# Altium schematic sheet Controller_Section.SchDoc
size A4; DocumentNumber: 7; SheetNumber: 7; SheetTotal: 17
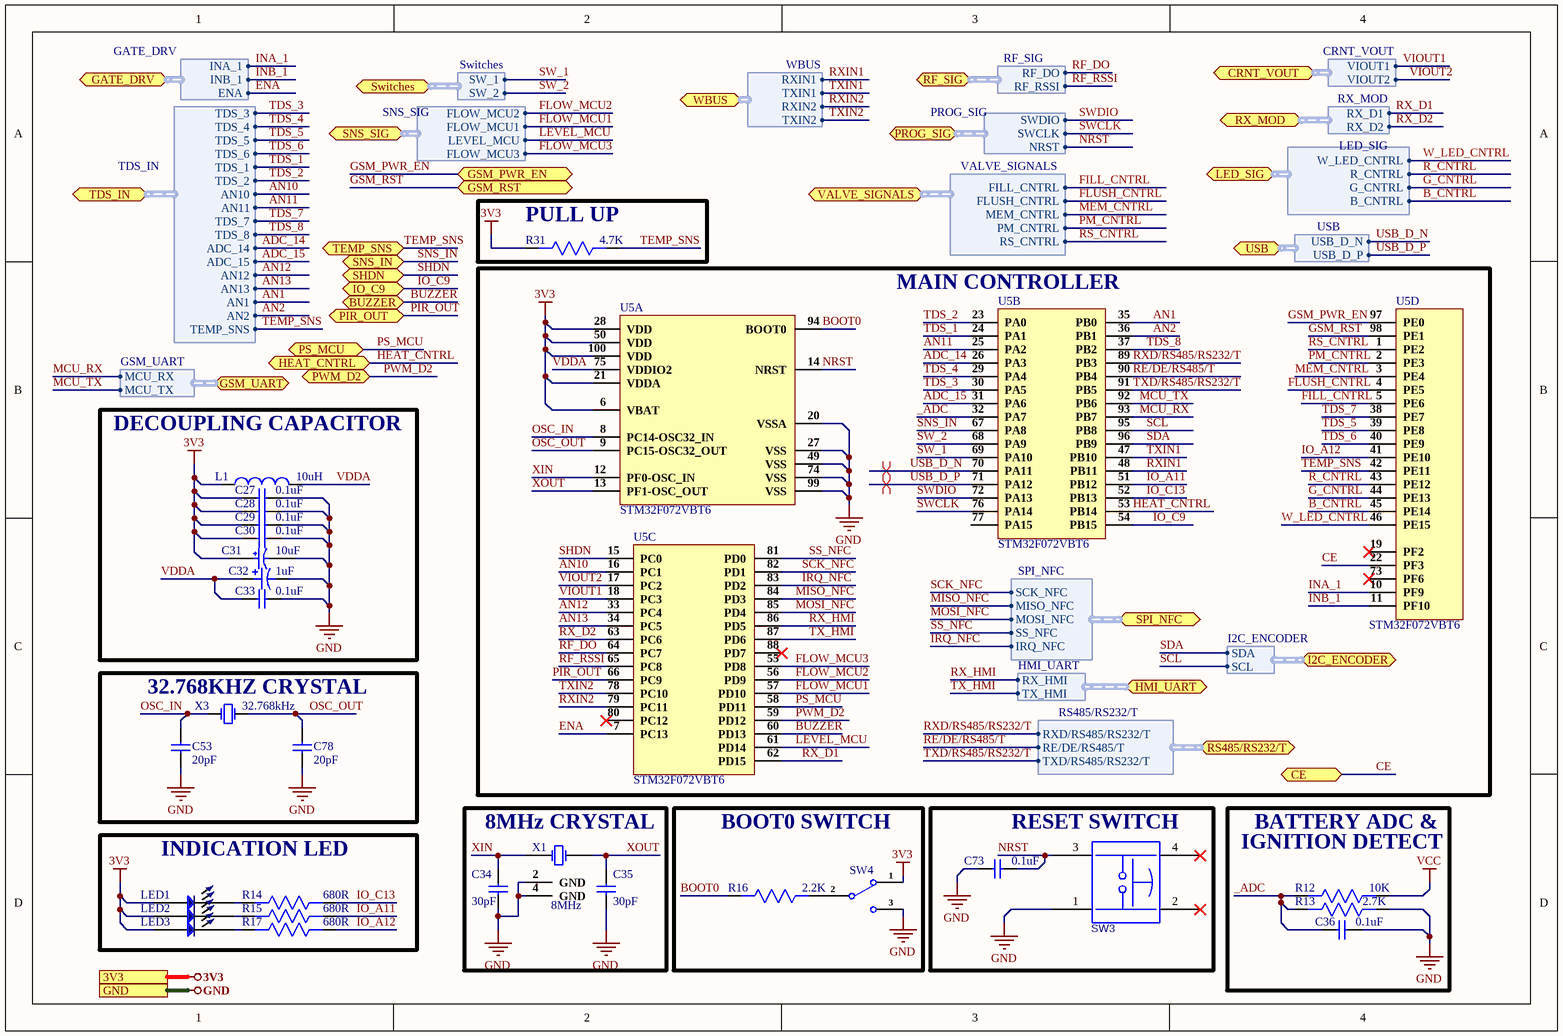
[diagram p0: Controller_Section.SchDoc]

## Parts
C27  0.1uF  [Cap0603]
C28  0.1uF  [Cap0603]
C29  0.1uF  [Cap0603]
C30  0.1uF  [Cap0603]
C31  10uF  [RVT1E100M0405.]
C32  1uF  [CAP-CASE A]
C33  0.1uF  [Cap0603]
C34  30pF  [Cap0603]
C35  30pF  [Cap0603]
C36  0.1uF  [Cap0603]
C53  20pF  [Cap0603]
C73  0.1uF  [Cap0603]
C78  20pF  [Cap0603]
L1  10uH  [Ind0805]
LED1  XZMDK68W-2  [LED 0402]  (value not drawn)
LED2  XZMDK68W-2  [LED 0402]  (value not drawn)
LED3  XZMDK68W-2  [LED 0402]  (value not drawn)
R12  10K  [Res-0603]
R13  2.7K  [Res-0603]
R14  680R  [RES-0603]
R15  680R  [RES-0603]
R16  2.2K  [RES-0603]
R17  680R  [RES-0603]
R31  4.7K  [RES-0603]
SW3  Tactile Switch  [TL3300CF160Q]  (value not drawn)
SW4  SS-12D02-G040  [SS-12D02-G040]  (value not drawn)
U5  STM32F072VBT6  [LQFP-100]  (parts A,B,C,D of 4)
X1  8MHz  [XC32M4-8.000-F18LJDT]
X3  32.768kHz  [X321532768KGD2SI]

## Blocks framed on the sheet
PULL UP: R31
MAIN CONTROLLER: U5
DECOUPLING CAPACITOR: C27-C33 L1
32.768KHZ CRYSTAL: C53 C78 X3
INDICATION LED: LED1-LED3 R14 R15 R17
8MHz CRYSTAL: C34 C35 X1
BOOT0 SWITCH: R16 SW4
RESET SWITCH: C73 SW3

## Ports
3V3, BUZZER (bidir), CE (bidir), CRNT_VOUT (bidir, harness CRNT_VOUT), GATE_DRV (bidir, harness GATE_DRV), GND, GSM_PWR_EN (bidir), GSM_RST (bidir), GSM_UART (bidir, harness GSM_UART), HEAT_CNTRL (bidir), HMI_UART (bidir, harness HMI_UART), I2C_ENCODER (bidir, harness I2C_ENCODER), IO_C9 (bidir), LED_SIG (bidir, harness LED_SIG), PIR_OUT (bidir), PROG_SIG (bidir, harness PROG_SIG), PS_MCU (bidir), PWM_D2 (bidir), RF_SIG (bidir, harness RF_SIG), RS485/RS232/T (bidir, harness RS485/RS232/T), RX_MOD (bidir, harness RX_MOD), SHDN (bidir), SNS_IN (bidir), SNS_SIG (bidir, harness SNS_SIG), SPI_NFC (bidir, harness SPI_NFC), Switches (bidir, harness Switches), TDS_IN (bidir, harness TDS_IN), TEMP_SNS (bidir), USB (bidir, harness USB), VALVE_SIGNALS (bidir, harness VALVE_SIGNALS), WBUS (bidir, harness WBUS)

## Harnesses
PROG_SIG: SWDIO, SWCLK, NRST
GATE_DRV: INA_1, INB_1, ENA
LED_SIG: R_CNTRL, G_CNTRL, B_CNTRL, W_LED_CNTRL
VALVE_SIGNALS: FILL_CNTRL, FLUSH_CNTRL, MEM_CNTRL, PM_CNTRL, RS_CNTRL
SNS_SIG: FLOW_MCU1, LEVEL_MCU, FLOW_MCU2, FLOW_MCU3
WBUS: RXIN1, TXIN1, RXIN2, TXIN2
RF_SIG: RF_DO, RF_RSSI
RX_MOD: RX_D1, RX_D2
CRNT_VOUT: VIOUT1, VIOUT2
TDS_IN: TDS_1, TDS_2, AN10, AN11, TDS_3, TDS_4, TDS_5, TDS_6, TDS_7, TDS_8, ADC_14, ADC_15, AN12, AN13, AN1, AN2, TEMP_SNS
USB: USB_D_N, USB_D_P
Switches: SW_1, SW_2
HMI_UART: RX_HMI, TX_HMI
GSM_UART: MCU_RX, MCU_TX
I2C_ENCODER: SDA, SCL
SPI_NFC: MISO_NFC, MOSI_NFC, SS_NFC, IRQ_NFC, SCK_NFC
RS485/RS232/T: RXD/RS485/RS232/T, RE/DE/RS485/T, TXD/RS485/RS232/T

## Nets
3V3: C27.1 C28.1 C29.1 C30.1 C31.1 L1.1 LED1.1 LED2.1 LED3.1 R31.2 SW4.1 U5.6(VBAT) U5.21(VDDA) U5.28(VDD) U5.50(VDD) U5.100(VDD) ; port 3V3
GND: C27.2 C28.2 C29.2 C30.2 C31.2 C32.2 C33.2 C34.1 C35.1 C36.2 C53.1 C73.1 C78.1 R13.1 SW3.1 SW4.3 U5.20(VSSA) U5.27(VSS) U5.49(VSS) U5.74(VSS) U5.99(VSS) X1.2(GND) X1.4(GND) ; port GND
VCC: R12.1
_ADC: C36.1 R12.2 R13.2 U5.32(PA7)
ADC_14: U5.26(PA3) ; port TDS_IN.ADC_14
ADC_15: U5.31(PA6) ; port TDS_IN.ADC_15
AN1: U5.35(PB0) ; port TDS_IN.AN1
AN2: U5.36(PB1) ; port TDS_IN.AN2
AN10: U5.16(PC1) ; port TDS_IN.AN10
AN11: U5.25(PA2) ; port TDS_IN.AN11
AN12: U5.33(PC4) ; port TDS_IN.AN12
AN13: U5.34(PC5) ; port TDS_IN.AN13
B_CNTRL: U5.45(PE14) ; port LED_SIG.B_CNTRL
BOOT0: R16.2 U5.94(BOOT0)
BUZZER: U5.60(PD13) ; port BUZZER
CE: U5.22(PF3) ; port CE
ENA: U5.7(PC13) ; port GATE_DRV.ENA
FILL_CNTRL: U5.5(PE6) ; port VALVE_SIGNALS.FILL_CNTRL
FLOW_MCU1: U5.57(PD10) ; port SNS_SIG.FLOW_MCU1
FLOW_MCU2: U5.56(PD9) ; port SNS_SIG.FLOW_MCU2
FLOW_MCU3: U5.55(PD8) ; port SNS_SIG.FLOW_MCU3
FLUSH_CNTRL: U5.4(PE5) ; port VALVE_SIGNALS.FLUSH_CNTRL
G_CNTRL: U5.44(PE13) ; port LED_SIG.G_CNTRL
GSM_PWR_EN: U5.97(PE0) ; port GSM_PWR_EN
GSM_RST: U5.98(PE1) ; port GSM_RST
HEAT_CNTRL: U5.53(PB14) ; port HEAT_CNTRL
INA_1: U5.10(PF9) ; port GATE_DRV.INA_1
INB_1: U5.11(PF10) ; port GATE_DRV.INB_1
IO_A11: R15.1 U5.51(PB12)
IO_A12: R17.1 U5.41(PE10)
IO_C9: U5.54(PB15) ; port IO_C9
IO_C13: R14.1 U5.52(PB13)
IRQ_NFC: U5.83(PD2) ; port SPI_NFC.IRQ_NFC
LEVEL_MCU: U5.61(PD14) ; port SNS_SIG.LEVEL_MCU
MCU_RX: U5.93(PB7) ; port GSM_UART.MCU_RX
MCU_TX: U5.92(PB6) ; port GSM_UART.MCU_TX
MEM_CNTRL: U5.3(PE4) ; port VALVE_SIGNALS.MEM_CNTRL
MISO_NFC: U5.84(PD3) ; port SPI_NFC.MISO_NFC
MOSI_NFC: U5.85(PD4) ; port SPI_NFC.MOSI_NFC
NRST: C73.2 SW3.3 U5.14(NRST) ; port PROG_SIG.NRST
OSC_IN: C53.2 U5.8(PC14-OSC32_IN) X3.1(OSC1)
OSC_OUT: C78.2 U5.9(PC15-OSC32_OUT) X3.2(OSC2)
PIR_OUT: U5.66(PC9) ; port PIR_OUT
PM_CNTRL: U5.2(PE3) ; port VALVE_SIGNALS.PM_CNTRL
PS_MCU: U5.58(PD11) ; port PS_MCU
PWM_D2: U5.59(PD12) ; port PWM_D2
R_CNTRL: U5.43(PE12) ; port LED_SIG.R_CNTRL
RE/DE/RS485/T: U5.90(PB4) ; port RS485/RS232/T.RE/DE/RS485/T
RF_DO: U5.64(PC7) ; port RF_SIG.RF_DO
RF_RSSI: U5.65(PC8) ; port RF_SIG.RF_RSSI
RS_CNTRL: U5.1(PE2) ; port VALVE_SIGNALS.RS_CNTRL
RX_D1: U5.62(PD15) ; port RX_MOD.RX_D1
RX_D2: U5.63(PC6) ; port RX_MOD.RX_D2
RX_HMI: U5.86(PD5) ; port HMI_UART.RX_HMI
RXD/RS485/RS232/T: U5.89(PB3) ; port RS485/RS232/T.RXD/RS485/RS232/T
RXIN1: U5.48(PB11) ; port WBUS.RXIN1
RXIN2: U5.79(PC11) ; port WBUS.RXIN2
SCK_NFC: U5.82(PD1) ; port SPI_NFC.SCK_NFC
SCL: U5.95(PB8) ; port I2C_ENCODER.SCL
SDA: U5.96(PB9) ; port I2C_ENCODER.SDA
SHDN: U5.15(PC0) ; port SHDN
SNS_IN: U5.67(PA8) ; port SNS_IN
SS_NFC: U5.81(PD0) ; port SPI_NFC.SS_NFC
SW_1: U5.69(PA10) ; port Switches.SW_1
SW_2: U5.68(PA9) ; port Switches.SW_2
SWCLK: U5.76(PA14) ; port PROG_SIG.SWCLK
SWDIO: U5.72(PA13) ; port PROG_SIG.SWDIO
TDS_1: U5.24(PA1) ; port TDS_IN.TDS_1
TDS_2: U5.23(PA0) ; port TDS_IN.TDS_2
TDS_3: U5.30(PA5) ; port TDS_IN.TDS_3
TDS_4: U5.29(PA4) ; port TDS_IN.TDS_4
TDS_5: U5.39(PE8) ; port TDS_IN.TDS_5
TDS_6: U5.40(PE9) ; port TDS_IN.TDS_6
TDS_7: U5.38(PE7) ; port TDS_IN.TDS_7
TDS_8: U5.37(PB2) ; port TDS_IN.TDS_8
TEMP_SNS: R31.1 U5.42(PE11) ; port TEMP_SNS, port TDS_IN.TEMP_SNS
TX_HMI: U5.87(PD6) ; port HMI_UART.TX_HMI
TXD/RS485/RS232/T: U5.91(PB5) ; port RS485/RS232/T.TXD/RS485/RS232/T
TXIN1: U5.47(PB10) ; port WBUS.TXIN1
TXIN2: U5.78(PC10) ; port WBUS.TXIN2
USB_D_N: U5.70(PA11) ; port USB.USB_D_N
USB_D_P: U5.71(PA12) ; port USB.USB_D_P
VDDA: C32.1 C33.1 L1.2 U5.75(VDDIO2)
VIOUT1: U5.18(PC3) ; port CRNT_VOUT.VIOUT1
VIOUT2: U5.17(PC2) ; port CRNT_VOUT.VIOUT2
W_LED_CNTRL: U5.46(PE15) ; port LED_SIG.W_LED_CNTRL
XIN: C34.2 U5.12(PF0-OSC_IN) X1.1(CRYSTAL)
XOUT: C35.2 U5.13(PF1-OSC_OUT) X1.3(CRYSTAL)
NetLED1_2: LED1.2 R14.2
NetLED2_2: LED2.2 R15.2
NetLED3_2: LED3.2 R17.2
NetR16_1: R16.1 SW4.2

Not connected (* = marked no-connect by the designer): SW3 2* 4*; U5 19(PF2)* 73(PF6)* 77(PA15) 80(PC12)* 88(PD7)*

## Layout directives
differential pair; differential pair class USB_D_Lines; net class USB_D; rule Matched Net Lengths [Tolerance = 50mil]; rule Impedance Constraint [Min = 85.00    Max = 90.00    ]: USB_D_N, USB_D_P

## Notes on the sheet
- IGNITION DETECT
- BATTERY ADC &

## Library data of the parts
C27-C30 C33 C36 C73 = CC0603ZRY5V9BB104: CAP CER 0.1UF 50V Y5V 0603; Manufacturer: Yageo; Capacitance: 100nF; Tolerance: 80%; Supplier 1: Digi-Key; Manufacturer Part Number: CC0603ZRY5V9BB104; Stock 1: 15000880; Pricing 1: 1=0.1, 10=0.075, 100=0.0334, 500=0.02386, 1000=0.01874 (USD); Mount: Surface Mount; Case/Package: 0603; Number of Pins: 2; Case Code (Metric): 1608; Case Code (Imperial): 0603; Min Operating Temperature: -30°C; Max Operating Temperature: 85°C; Dielectric: Y5V; Voltage Rating: 50V; Package Quantity: 1; Packaging: Tape and Reel; Voltage Rating (DC): 50V; Termination: SMD/SMT; Composition: Ceramic; Voltage: 50V; Length: 1.6mm; Height: 0.8mm; Width: 0.031inch; Thickness: 0.035inch; Depth: 0.8mm; Radiation Hardening: No; REACH SVHC: No SVHC; Lead Free: Lead Free; Halogen Free: Halogen Free; ComponentLink1URL: http://www.yageo.com/documents/recent/UPY-GPHC_Y5V_6.3V-to-50V_8.pdf?src-supplier=Digi-Key; ComponentLink1Description: http://www.yageo.com/documents/recent/UPY-GPHC_Y5V_6.3V-to-50V_8.pdf?src-supplier=Digi-Key; ComponentLink2URL: http://www.yageo.com/documents/recent/UPY-GPHC_Y5V_6.3V-to-50V_5.pdf?src-supplier=Avnet+Europe; ComponentLink2Description: http://www.yageo.com/documents/recent/UPY-GPHC_Y5V_6.3V-to-50V_5.pdf?src-supplier=Avnet+Europe; ComponentLink3URL: https://www.verical.com/server-webapp/html/getDatasheet?partID=403611&src-supplier=Verical; ComponentLink3Description: https://www.verical.com/server-webapp/html/getDatasheet?partID=403611&src-supplier=Verical; ComponentLink4URL: http://www.mouser.com/ds/2/447/Yageo_UPY-GP_NP0_16V-to-50V_9-358835.pdf?src-supplier=Mouser; ComponentLink4Description: http://www.mouser.com/ds/2/447/Yageo_UPY-GP_NP0_16V-to-50V_9-358835.pdf?src-supplier=Mouser; ComponentLink5URL: http://www.farnell.com/datasheets/1132289.pdf?src-supplier=Element14; ComponentLink5Description: http://www.farnell.com/datasheets/1132289.pdf?src-supplier=Element14; Supplier Part Number 1: 311-1343-1-ND
C31 = RVT1E100M0405: CAP ALUM 10uF 25V SMD; Manufacturer: ROQANG; φD: 4mm; L: 5.4mm; Tolerance: ±20%; Operating Temperature: -45℃~+105℃; Rated Voltage: 25V; Capacitance: 10uF
C32 = T491A105K025AT: Cap Tant Solid 1uF 25V A CASE 10% (3.2 X 1.6 X 1.6mm) Inward L SMD 3216-18 8 Ohm 125°C T/R; Manufacturer: KEMET; Dielectric Material: Tantalum; ESR (Equivalent Series Resistance): 8R; Tolerance: 20%; Life (Hours): 2000Hour; Polarity: Polar; Dissipation Factor: 4%; Leakage Current: 500nA; Supplier 1: Arrow Electronics; Manufacturer Part Number: T491A105K025AT; RoHS: Yes; Category: Tantalum Capacitors; Stock 1: 30000; Pricing 1: 2000=0.09910, 4000=0.09460 (USD); Mount: Surface Mount,PCB; Case/Package: 1206; Number of Pins: 2; Case Code (Imperial): 1206; Case Code (Metric): 3216; Min Operating Temperature: -55°C; Max Operating Temperature: 125°C; Capacitance: 1uF; Packaging: Tape and Reel; Voltage Rating: 25V; Features: General Purpose; Package Quantity: 1; Voltage Rating (DC): 25V; Termination: SMD/SMT; Voltage: 25V; Length: 3.2mm; Width: 1.6mm; Height: 1.6mm; Depth: 1.6mm; Height - Seated (Max): 0.071inch; Lead Pitch: 1.2mm; Radiation Hardening: No; RoHS Compliant: Yes; Lead Free: Lead Free; REACH SVHC: No SVHC; ComponentLink1URL: https://datasheet.ciiva.com/34302/1573185-34302503.pdf?src-supplier=Jameco; ComponentLink1Description: https://datasheet.ciiva.com/34302/1573185-34302503.pdf?src-supplier=Jameco; ComponentLink2URL: https://datasheet.ciiva.com/7758/1854511-7758878.pdf?src-supplier=Element14; ComponentLink2Description: https://datasheet.ciiva.com/7758/1854511-7758878.pdf?src-supplier=Element14; ComponentLink3URL: https://datasheet.ciiva.com/7758/1446014-7758877.pdf?src-supplier=Element14; ComponentLink3Description: https://datasheet.ciiva.com/7758/1446014-7758877.pdf?src-supplier=Element14; ComponentLink4URL: https://datasheet.ciiva.com/7758/1446014-7758879.pdf?src-supplier=Element14; ComponentLink4Description: https://datasheet.ciiva.com/7758/1446014-7758879.pdf?src-supplier=Element14; ComponentLink5URL: https://datasheet.ciiva.com/5934/1446014-5934519.pdf?src-supplier=Farnell; ComponentLink5Description: https://datasheet.ciiva.com/5934/1446014-5934519.pdf?src-supplier=Farnell; ComponentLink6URL: https://datasheet.ciiva.com/7758/1698764-7758876.pdf?src-supplier=Element14; ComponentLink6Description: https://datasheet.ciiva.com/7758/1698764-7758876.pdf?src-supplier=Element14; ComponentLink7URL: https://datasheet.ciiva.com/257/kem-t2005-t491-257555.pdf?src-supplier=Digi-Key; ComponentLink7Description: https://datasheet.ciiva.com/257/kem-t2005-t491-257555.pdf?src-supplier=Digi-Key; ComponentLink8URL: https://datasheet.ciiva.com/257/kem-t2005-t491-257554.pdf?src-supplier=Digi-Key; ComponentLink8Description: https://datasheet.ciiva.com/257/kem-t2005-t491-257554.pdf?src-supplier=Digi-Key; ComponentLink9URL: https://datasheet.ciiva.com/257/kem-t2005-t491-257556.pdf?src-supplier=Digi-Key; ComponentLink9Description: https://datasheet.ciiva.com/257/kem-t2005-t491-257556.pdf?src-supplier=Digi-Key; ComponentLink10URL: https://datasheet.ciiva.com/14586/70095774-14586698.pdf?src-supplier=Allied+Electronics; ComponentLink10Description: https://datasheet.ciiva.com/14586/70095774-14586698.pdf?src-supplier=Allied+Electronics; ComponentLink11URL: https://datasheet.ciiva.com/18095/getdatasheetpartid-120995-18095948.pdf?src-supplier=Verical; ComponentLink11Description: https://datasheet.ciiva.com/18095/getdatasheetpartid-120995-18095948.pdf?src-supplier=Verical; Supplier Part Number 1: T491A105K025AT
C34 C35 = CC0603JRNPO9BN300: CAP 30pF NP0 0603 50 V ±5 % SMD; Manufacturer: Yageo; Tolerance: 5%; Dielectric: C0G; Voltage Rating: 50V; Dissipation Factor: 0.1%; Insulation Resistance: 10GR; Supplier 1: Digi-Key; Manufacturer Part Number: CC0603JRNPO9BN300; RoHS: Yes; Category: Ceramic Capacitors; Stock 1: 36700; Pricing 1: 1=0.10000, 10=0.06800, 50=0.03700, 100=0.03020, 500=0.02160, 1000=0.01697 (USD); Mount: Surface Mount; Case/Package: 0603; Number of Pins: 2; Case Code (Imperial): 0603; Case Code (Metric): 1608; Weight: 7.1E-05oz; Min Operating Temperature: -55°C; Max Operating Temperature: 125°C; Capacitance: 30pF; Packaging: Tape and Reel; Voltage Rating (DC): 50V; Termination: SMD/SMT; Resistor Type: Ceramic; Series: CC; Construction: Flat; Length: 1.6mm; Width: 0.031inch; Height: 0.8mm; Thickness: 0.035inch; Depth: 0.8mm; Radiation Hardening: No; REACH SVHC: No SVHC; Lead Free: Lead Free; RoHS Compliant: Yes; ComponentLink1URL: https://datasheet.ciiva.com/26862/getdatasheetpartid-403531-26862766.pdf?src-supplier=Verical; ComponentLink1Description: https://datasheet.ciiva.com/26862/getdatasheetpartid-403531-26862766.pdf?src-supplier=Verical; ComponentLink2URL: https://datasheet.ciiva.com/13264/upy-gp-np0-16v-to-50v-8-3714-13264406.pdf?src-supplier=Mouser; ComponentLink2Description: https://datasheet.ciiva.com/13264/upy-gp-np0-16v-to-50v-8-3714-13264406.pdf?src-supplier=Mouser; ComponentLink3URL: https://datasheet.ciiva.com/7978/1132289-7978140.pdf?src-supplier=Element14; ComponentLink3Description: https://datasheet.ciiva.com/7978/1132289-7978140.pdf?src-supplier=Element14; ComponentLink4URL: https://datasheet.ciiva.com/28450/1443161-28450494.pdf?src-supplier=Element14; ComponentLink4Description: https://datasheet.ciiva.com/28450/1443161-28450494.pdf?src-supplier=Element14; Supplier Part Number 1: 311-3357-1-ND
C53 C78 = CC0603JRNPO9BN200: CAP CER 20PF 50V C0G/NPO 0603; Manufacturer: Yageo; Tolerance: 5%; Dielectric: C0G; Supplier 1: Digi-Key; Manufacturer Part Number: CC0603JRNPO9BN200; Stock 1: 180060; Pricing 1: 1=0.1, 10=0.046, 100=0.0205, 500=0.01466, 1000=0.01152 (USD); Mount: Surface Mount; Case/Package: 0603; Number of Pins: 2; Weight: 7.1E-05oz; Case Code (Imperial): 0603; Case Code (Metric): 1608; Min Operating Temperature: -55°C; Max Operating Temperature: 125°C; Capacitance: 20pF; Package Quantity: 4000; Voltage Rating (DC): 50V; Packaging: Tape and Reel; Voltage Rating: 50V; Termination: SMD/SMT; Composition: Ceramic; Length: 1.6mm; Width: 0.8mm; Thickness: 0.035inch; Depth: 0.8mm; REACH SVHC: Unknown; Lead Free: Lead Free; ComponentLink1URL: http://www.farnell.com/datasheets/1132289.pdf?src-supplier=Element14; ComponentLink1Description: http://www.farnell.com/datasheets/1132289.pdf?src-supplier=Element14; ComponentLink2URL: http://www.yageo.com/documents/recent/UPY-GP_NP0_16V-to-50V_16.pdf?src-supplier=Digi-Key; ComponentLink2Description: http://www.yageo.com/documents/recent/UPY-GP_NP0_16V-to-50V_16.pdf?src-supplier=Digi-Key; Supplier Part Number 1: 311-1424-1-ND
L1 = MGFL2012F100MT-LF: 500mA 10uH ±20% 320mΩ 0805 Inductors; Manufacturer: Microgate; Manufacturer Part Number: MGFL2012F100MT-LF; Value: 10uH; Footprint: 0805; ComponentLink1Description: New link; ComponentLink1URL: https://lcsc.com/product-detail/Inductors-SMD_microgate-MGFL2012F100MT-LF_C281113.html
LED1-LED3 = XZMDK68W-2: LED RED CLEAR CHIP SMD; Manufacturer: SunLED; Lens Color: Colorless; Luminous Intensity: 69mcd; Test Current: 20mA; Viewing Angle: 120°; Dominant Wavelength: 630nm; Forward Voltage: 1.95V; Supplier 1: Digi-Key; Manufacturer Part Number: XZMDK68W-2; Stock 1: 69539; Pricing 1: 1=0.43, 10=0.306, 100=0.136, 500=0.0952, 1000=0.0782 (USD); Mount: Surface Mount; Case/Package: 0402; Color: Red; Case Code (Metric): 1005; Case Code (Imperial): 0402; Packaging: Tape and Reel; Lens Transparency: Clear; Length: 1mm; Height: 0.6mm; Width: 0.5mm; ComponentLink1URL: http://www.sunledusa.com/products/spec/XZMDK68W-2.pdf?src-supplier=Digi-Key; ComponentLink1Description: http://www.sunledusa.com/products/spec/XZMDK68W-2.pdf?src-supplier=Digi-Key; ComponentLink2URL: https://www.sunledusa.com/products/spec/XZMDK68W-2.pdf?src-supplier=Digi-Key; ComponentLink2Description: https://www.sunledusa.com/products/spec/XZMDK68W-2.pdf?src-supplier=Digi-Key; Supplier Part Number 1: 1497-1174-6-ND
R12 = RC0603FR-0710KL: RES SMD 10K Ohm 1% 1/10W 0603; Manufacturer: Yageo; Resistance: 10kR; Temperature Coefficient: 100ppm/°C; Voltage Rating (DC): 50V; Power Rating: 100mW; Voltage Rating: 75V; Supplier 1: Digi-Key; Manufacturer Part Number: RC0603FR-0710KL; RoHS: Yes; Category: Chip SMD Resistors; Stock 1: 25249139; Pricing 1: 1=0.10000, 10=0.02400, 100=0.00970, 1000=0.00436, 2500=0.00378 (USD); Case/Package: 0603; Number of Pins: 2; Case Code (Imperial): 0603; Case Code (Metric): 1608; Weight: 7.1E-05oz; Size Code: 0603; Min Operating Temperature: -55°C; Max Operating Temperature: 155°C; Tolerance: 1%; Resistor Type: Thick Film; Packaging: Tape and Reel; Termination: SMD/SMT; Features: Moisture Resistant; Series: RC; Max Power Dissipation: 100mW; Number of Terminations: 2; Resistance Tolerance: 1%; Construction: Rectangular; Length: 1.6mm; Width: 0.8mm; Height: 0.45mm; Depth: 0.8mm; Lead Pitch: 0.3mm; REACH SVHC: Unknown; Lead Free: Lead Free; Military Standard: Not; RoHS Compliant: Yes; ComponentLink1URL: https://datasheet.ciiva.com/7660/38590-7660789.pdf?src-supplier=Element14; ComponentLink1Description: https://datasheet.ciiva.com/7660/38590-7660789.pdf?src-supplier=Element14; ComponentLink2URL: https://datasheet.ciiva.com/7983/443971-7983596.pdf?src-supplier=Element14; ComponentLink2Description: https://datasheet.ciiva.com/7983/443971-7983596.pdf?src-supplier=Element14; ComponentLink3URL: https://datasheet.ciiva.com/22747/443971-22747519.pdf?src-supplier=Element14; ComponentLink3Description: https://datasheet.ciiva.com/22747/443971-22747519.pdf?src-supplier=Element14; ComponentLink4URL: https://datasheet.ciiva.com/46440/1868787-46440891.pdf?src-supplier=Element14; ComponentLink4Description: https://datasheet.ciiva.com/46440/1868787-46440891.pdf?src-supplier=Element14; ComponentLink5URL: https://datasheet.ciiva.com/7746/1738695-7746239.pdf?src-supplier=Element14; ComponentLink5Description: https://datasheet.ciiva.com/7746/1738695-7746239.pdf?src-supplier=Element14; ComponentLink6URL: https://datasheet.ciiva.com/15189/getdatasheetpartid-409289-15189591.pdf?src-supplier=Verical; ComponentLink6Description: https://datasheet.ciiva.com/15189/getdatasheetpartid-409289-15189591.pdf?src-supplier=Verical; Supplier Part Number 1: 311-10.0KHRCT-ND; LCSC Part Number: C98220
R13 = RC0603FR-072K7L: RES 2.7K OHM 1% 1/10W 0603; Manufacturer: Yageo; Resistance: 2.7kR; Voltage Rating (DC): 50V; Temperature Coefficient: 100ppm/°C; Power Rating: 100mW; Supplier 1: Digi-Key; Manufacturer Part Number: RC0603FR-072K7L; RoHS: Yes; Category: Chip SMD Resistors; Stock 1: 764111; Pricing 1: 1=0.10000, 10=0.02100, 100=0.00850, 1000=0.00383, 2500=0.00332 (USD); Case/Package: 0603; Number of Pins: 2; Case Code (Imperial): 0603; Case Code (Metric): 1608; Size Code: 0603; Min Operating Temperature: -55°C; Max Operating Temperature: 155°C; Tolerance: 1%; Packaging: Tape and Reel; Resistor Type: Thick Film; Voltage Rating: 50V; Package Quantity: 1; Termination: SMD/SMT; Number of Terminations: 2; Max Power Dissipation: 100mW; Features: Moisture Resistant; Series: RC; Resistance Tolerance: 1%; Construction: Rectangular; Length: 0.063inch; Width: 0.031inch; Height: 0.022inch; Depth: 0.8mm; Reach SVHC Compliant: Yes; Lead Free: Lead Free; Military Standard: Not; RoHS Compliant: Yes; Supplier Part Number 1: 311-2.70KHRCT-ND
R14 R15 R17 = RC0603FR-07680RL: RES SMD 680 OHM 1% 1/10W 0603; Manufacturer: Yageo; Temperature Coefficient: 100ppm/°C; Voltage Rating (DC): 50V; Power Rating: 100mW; Supplier 1: Digi-Key; Manufacturer Part Number: RC0603FR-07680RL; Stock 1: 4278227; Pricing 1: 1=0.1, 10=0.024, 100=0.0097, 1000=0.00437, 2500=0.00379 (USD); Case/Package: 0603; Number of Pins: 2; Case Code (Imperial): 0603; Case Code (Metric): 1608; Min Operating Temperature: -55°C; Max Operating Temperature: 155°C; Resistance: 680R; Tolerance: 1%; Composition: Thick Film; Packaging: Tape and Reel; Number of Terminations: 2; Military Standard: Not; Voltage Rating: 50V; Package Quantity: 1; Termination: SMD/SMT; Max Power Dissipation: 100mW; Features: Moisture Resistant; Length: 1.6mm; Height: 0.022inch; Width: 0.031inch; Depth: 0.8mm; REACH SVHC: No SVHC; Lead Free: Lead Free; ComponentLink1URL: http://www.farnell.com/datasheets/1868787.pdf?src-supplier=Element14; ComponentLink1Description: http://www.farnell.com/datasheets/1868787.pdf?src-supplier=Element14; ComponentLink2URL: http://documents.rs-components.com/techlib://itc_doclist_GB.htm?stockno=5048221&src-supplier=RSComponents; ComponentLink2Description: http://documents.rs-components.com/techlib://itc_doclist_GB.htm?stockno=5048221&src-supplier=RSComponents; ComponentLink3URL: http://www.farnell.com/datasheets/443971.pdf?src-supplier=Element14; ComponentLink3Description: http://www.farnell.com/datasheets/443971.pdf?src-supplier=Element14; ComponentLink4URL: http://www.yageo.com/documents/recent/PYu-RC_Group_51_RoHS_L_10.pdf?src-supplier=Digi-Key; ComponentLink4Description: http://www.yageo.com/documents/recent/PYu-RC_Group_51_RoHS_L_10.pdf?src-supplier=Digi-Key; Supplier Part Number 1: 311-680HRCT-ND
R16 = RC0603FR-072K2L: RES SMD 2.2K OHM 1% 1/10W 0603; Manufacturer: Yageo Phycomp; Temperature Coefficient: 100ppm/°C; Resistance: 2.2kR; Power Rating: 100mW; Voltage Rating (DC): 50V; Supplier 1: Digi-Key; Manufacturer Part Number: RC0603FR-072K2L; Stock 1: 10587920; Pricing 1: 1=0.1, 10=0.023, 100=0.0094, 1000=0.00421, 2500=0.00366 (USD); Mount: Surface Mount; Case/Package: 0603; Number of Pins: 2; Min Operating Temperature: -55°C; Max Operating Temperature: 155°C; Tolerance: 1%; Packaging: Cut Tape; Length: 1.6mm; Height: 0.45mm; Width: 800um; Depth: 0.8mm; REACH SVHC: No SVHC; Lead Free: Lead Free; Supplier Part Number 1: 311-2.20KHRCT-ND
R31 = RC0603FR-074K7L: RES SMD 4.7K OHM 1% 1/10W 0603; Manufacturer: Yageo; Resistance: 4.7kR; Temperature Coefficient: 100ppm/°C; Voltage Rating (DC): 50V; Power Rating: 100mW; Supplier 1: Digi-Key; Manufacturer Part Number: RC0603FR-074K7L; Stock 1: 1924316; Pricing 1: 1=0.10000, 10=0.02400, 100=0.00970, 1000=0.00436, 2500=0.00378 (USD); Case/Package: 0603; Number of Pins: 2; Case Code (Imperial): 0603; Case Code (Metric): 1608; Min Operating Temperature: -55°C; Max Operating Temperature: 155°C; Tolerance: 1%; Packaging: Tape and Reel; Voltage Rating: 50V; Termination: SMD/SMT; Military Standard: Not; Length: 1.6mm; Width: 0.8mm; Depth: 0.8mm; REACH SVHC: No SVHC; Lead Free: Lead Free; ComponentLink1URL: https://datasheet.ciiva.com/15189/getdatasheetpartid-422754-15189760.pdf?src-supplier=Verical; ComponentLink1Description: https://datasheet.ciiva.com/15189/getdatasheetpartid-422754-15189760.pdf?src-supplier=Verical; Supplier Part Number 1: 311-4.70KHRCT-ND; RoHS: Yes; Category: Chip SMD Resistors; Size Code: 0603; Resistor Type: Thick Film; Features: Moisture Resistant; Series: RC; Max Power Dissipation: 100mW; Number of Terminations: 2; Construction: Rectangular; Resistance Tolerance: 1%; Height: 0.45mm; Lead Pitch: 0.3mm; RoHS Compliant: Yes; ComponentLink2URL: https://datasheet.ciiva.com/22747/443971-22747528.pdf?src-supplier=Element14; ComponentLink2Description: https://datasheet.ciiva.com/22747/443971-22747528.pdf?src-supplier=Element14; ComponentLink3URL: https://datasheet.ciiva.com/7660/38590-7660794.pdf?src-supplier=Element14; ComponentLink3Description: https://datasheet.ciiva.com/7660/38590-7660794.pdf?src-supplier=Element14; ComponentLink4URL: https://datasheet.ciiva.com/7746/1868787-7746365.pdf?src-supplier=Element14; ComponentLink4Description: https://datasheet.ciiva.com/7746/1868787-7746365.pdf?src-supplier=Element14; ComponentLink5URL: https://datasheet.ciiva.com/46440/1868787-46440909.pdf?src-supplier=Element14; ComponentLink5Description: https://datasheet.ciiva.com/46440/1868787-46440909.pdf?src-supplier=Element14; ComponentLink6URL: https://datasheet.ciiva.com/7746/1738695-7746366.pdf?src-supplier=Element14; ComponentLink6Description: https://datasheet.ciiva.com/7746/1738695-7746366.pdf?src-supplier=Element14
SW3 = TL3300CF160Q: SWITCH TACTILE SPST-NO 0.05A 12V; Manufacturer: E-Switch; Mechanical Life: 200000Cycles; Operating Force: 160gf; Current Rating: 50mA; Throw Configuration: SPST; Contact Resistance: 100mR; Illumination Type: Non-Illuminated; Switch Travel: 0.35mm; Switch Function: Off-Mom; Actuator Type: Standard; Actuator Length: 5mm; Supplier 1: Mouser; Manufacturer Part Number: TL3300CF160Q; Stock 1: 1884; Pricing 1: 1=0.53, 10=0.513, 50=0.43, 100=0.393, 1000=0.293, 10000=0.274 (USD); Mount: Surface Mount; Case/Package: SMD/SMT; Contact Plating: Silver; Min Operating Temperature: -25°C; Max Operating Temperature: 70°C; Package Quantity: 1; Packaging: Tape and Reel; Voltage Rating (DC): 12V; Max Voltage Rating (DC): 12V; Termination: Gull Wing; Electrical Life: 200000Cycles; Orientation: Straight; Series: TL3300; Lead Free: Lead Free; RoHS Compliant: Yes; ComponentLink1URL: http://www.e-switch.com/system/asset/product_line/data_sheet/157/TL3300.pdf?src-supplier=Digi-Key; ComponentLink1Description: http://www.e-switch.com/system/asset/product_line/data_sheet/157/TL3300.pdf?src-supplier=Digi-Key; ComponentLink2URL: http://spec_sheets.e-switch.com/specs/N301102.pdf?src-supplier=Digi-Key; ComponentLink2Description: http://spec_sheets.e-switch.com/specs/N301102.pdf?src-supplier=Digi-Key; Supplier Part Number 1: 612-TL3300CF160Q
SW4 = SS-12D02-G040: Straight 1A SPDT 8.7mm 8.6mm 24V 4.5mm Black PCPin 10000 Rectangular columnar -25℃~+70℃ Plugin Slide Switches ROHS; Manufacturer: G-Switch; Item Type: Switch; Manufacturer Part Number: SS-12D02-G040; Package: Custom; LCSC Part Number: C2876023; ComponentLink1Description: LCSC; ComponentLink1URL: https://www.lcsc.com/product-detail/Slide-Switches_G-Switch-SS-12D02-G040_C2876023.html
U5 = STM32F072VBT6: IC MCU 32BIT 128KB FLASH 100LQFP; Manufacturer: STMicroelectronics; RAM Size: 16KB; Max Power Dissipation: 476mW; Interface: I2C,SPI,USB,CAN,HDMI,IrDA,UART,USART,LIN,I2S; Number of I/Os: 87; Number of Timers/Counters: 9; Frequency: 48MHz; Oscillator Type: Internal; Max Supply Voltage: 3.6V; Min Supply Voltage: 2V; Data Bus Width: 32b; Watchdog Timer: Yes; Number of ADC Channels: 19; Peripherals: POR,PWM,WDT,DMA; Core Architecture: ARM; Supplier 1: Newark; Manufacturer Part Number: STM32F072VBT6; RoHS: Yes; Category: Microcontrollers; Pricing 1: 1=8.45000, 10=7.60000, 25=7.18000, 50=6.70000, 100=6.23000 (USD); Mount: Surface Mount; Case/Package: LQFP; Number of Pins: 100; Min Operating Temperature: -40°C; Max Operating Temperature: 85°C; Packaging: Tray; Number of Programmable I/O: 87; Max Frequency: 48MHz; Memory Type: FLASH; Memory Size: 128KB; Package Quantity: 540; Radiation Hardening: No; RoHS Compliant: Yes; Lead Free: Lead Free; ComponentLink1URL: https://datasheet.ciiva.com/29987/dm00090510-29987095.pdf?src-supplier=Avnet; ComponentLink1Description: https://datasheet.ciiva.com/29987/dm00090510-29987095.pdf?src-supplier=Avnet; Supplier Part Number 1: 16AC3535
X1 = XC32M4-8.000-F18LJDT: 8MHz SMD Crystal Resonator 18pF 200Ω ±20ppm ±30ppm -40℃~+85℃ SMD3225-4P Crystals ROHS; Manufacturer: HCI; Manufacturer Part Number: XC32M4-8.000-F18LJDT; ComponentLink1Description: LCSC; ComponentLink1URL: https://www.lcsc.com/product-detail/Crystals_HCI-XC32M4-8-000-F18LJDT_C2905353.html
X3 = X321532768KGD2SI: 32.768kHz SMD Crystal Resonator 12.5pF ±20ppm -40℃~+85℃ SMD3215-2P Crystals ROHS; Manufacturer: Yangxing Tech; Manufacturer Part Number: X321532768KGD2SI; Footprint: Custom; ComponentLink1Description: LCSC; ComponentLink1URL: https://www.lcsc.com/product-detail/Crystals_Yangxing-Tech-X321532768KGD2SI_C620155.html